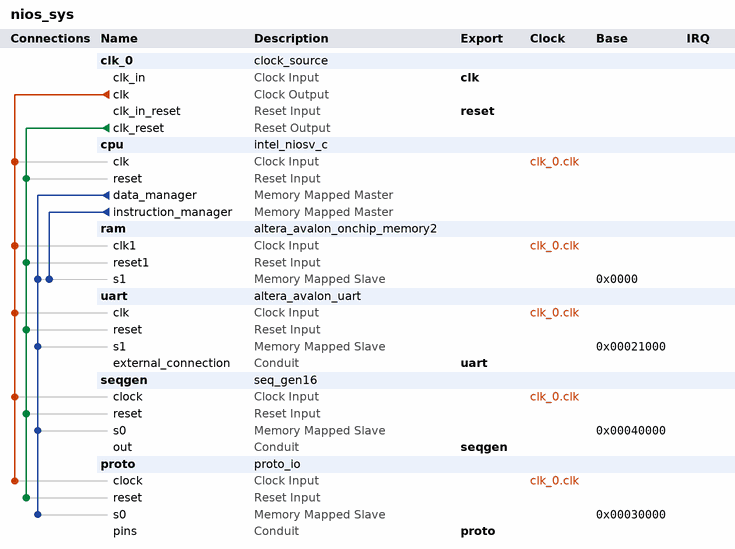
[diagram p0: system contents]
# Platform Designer (Qsys) system nios_sys, MAX 10 10M08SAE144C8G
# Parameters at their usual value, and those the tool derives, are not listed.
package require -exact qsys 25.1
create_system nios_sys
set_project_property DEVICE_FAMILY {MAX 10}
set_project_property DEVICE 10M08SAE144C8G

add_instance clk_0 clock_source 25.1
set_instance_parameter_value clk_0 clockFrequency 50000000
set_instance_parameter_value clk_0 resetSynchronousEdges DEASSERT

add_instance cpu intel_niosv_c 4.1.0
set_instance_parameter_value cpu archSize 32
set_instance_parameter_value cpu clockFrequency 50000000
set_instance_parameter_value cpu enableAvalonInterface true
set_instance_parameter_value cpu enableECCLite false
set_instance_parameter_value cpu enableResetReq false
set_instance_parameter_value cpu hartID 0
set_instance_parameter_value cpu numGpr 32
set_instance_parameter_value cpu resetOffset 0
set_instance_parameter_value cpu resetSlave Absolute
set_instance_parameter_value cpu useResetReq false

add_instance ram altera_avalon_onchip_memory2 25.1
set_instance_parameter_value ram blockType M9K
set_instance_parameter_value ram dataWidth 32
set_instance_parameter_value ram dualPort false
set_instance_parameter_value ram initMemContent true
set_instance_parameter_value ram initializationFileName onchip_ram.hex
set_instance_parameter_value ram memorySize 12288
set_instance_parameter_value ram useNonDefaultInitFile true

add_instance uart altera_avalon_uart 25.1
set_instance_parameter_value uart baud 115200
set_instance_parameter_value uart dataBits 8
set_instance_parameter_value uart fixedBaud true
set_instance_parameter_value uart parity NONE
set_instance_parameter_value uart stopBits 1

add_instance seqgen seq_gen16 1.0
set_instance_parameter_value seqgen CLK_HZ 50000000

add_instance proto proto_io 1.0
set_instance_parameter_value proto CLK_HZ 50000000

# connections
add_connection clk_0.clk cpu.clk clock
add_connection clk_0.clk proto.clock clock
add_connection clk_0.clk ram.clk1 clock
add_connection clk_0.clk seqgen.clock clock
add_connection clk_0.clk uart.clk clock
add_connection clk_0.clk_reset cpu.reset reset
add_connection clk_0.clk_reset proto.reset reset
add_connection clk_0.clk_reset ram.reset1 reset
add_connection clk_0.clk_reset seqgen.reset reset
add_connection clk_0.clk_reset uart.reset reset
add_connection cpu.data_manager proto.s0 avalon
set_connection_parameter_value cpu.data_manager/proto.s0 baseAddress 0x00030000
add_connection cpu.data_manager ram.s1 avalon
set_connection_parameter_value cpu.data_manager/ram.s1 baseAddress 0x0000
add_connection cpu.data_manager seqgen.s0 avalon
set_connection_parameter_value cpu.data_manager/seqgen.s0 baseAddress 0x00040000
add_connection cpu.data_manager uart.s1 avalon
set_connection_parameter_value cpu.data_manager/uart.s1 baseAddress 0x00021000
add_connection cpu.instruction_manager ram.s1 avalon
set_connection_parameter_value cpu.instruction_manager/ram.s1 baseAddress 0x0000

# exported interfaces
add_interface clk clock sink
set_interface_property clk EXPORT_OF clk_0.clk_in
add_interface proto conduit end
set_interface_property proto EXPORT_OF proto.pins
add_interface reset reset sink
set_interface_property reset EXPORT_OF clk_0.clk_in_reset
add_interface seqgen conduit end
set_interface_property seqgen EXPORT_OF seqgen.out
add_interface uart conduit end
set_interface_property uart EXPORT_OF uart.external_connection

set_interconnect_requirement {$system} qsys_mm.clockCrossingAdapter HANDSHAKE
set_interconnect_requirement {$system} qsys_mm.enableEccProtection FALSE
set_interconnect_requirement {$system} qsys_mm.insertDefaultSlave FALSE
set_interconnect_requirement {$system} qsys_mm.maxAdditionalLatency 1

save_system nios_sys.qsys
